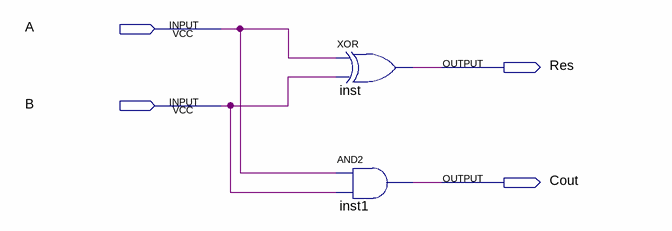
[diagram p0: schematic sheet]
// Quartus schematic MeioSomador.bdf as structural Verilog: 2 symbols, 4 pins
module MeioSomador (
  input  A,
  input  B,
  output Res,
  output Cout
);

  xor inst (Res, A, B);
  and inst1 (Cout, A, B);
endmodule
